# Altium schematic sheet VINREG.SchDoc
size B; SheetNumber: 1; SheetTotal: 4
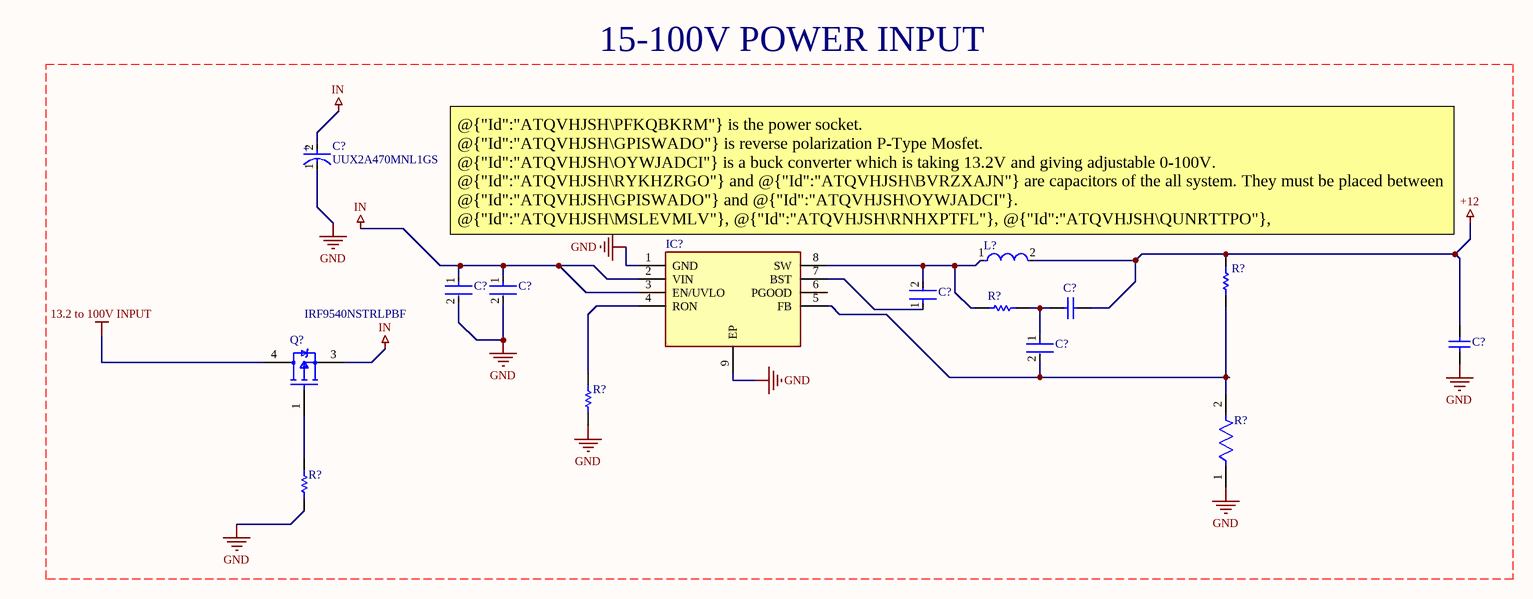
[diagram p0: VINREG.SchDoc]

## Parts
(Parts that share a designator on the sheet are numbered #1, #2 ... from top to bottom, then left to right.)
C?#1  UUX2A470MNL1GS  [FP-UUX2A470MNL1GS-MFG]
C?#2  C3216X7S2A225K160AB  [FP-C3216-160-0_2-IPC_B]  (value not drawn)
C?#3  C3216X7S2A225K160AB  [FP-C3216-160-0_2-IPC_B]  (value not drawn)
C?#4  CAP 3.3nF 16V 0805(2012)  [CAPC0805(2012)145_M]  (value not drawn)
C?#5  C1206C222J5GACTU  [FP-C1206C-EB-MFG]  (value not drawn)
C?#6  C0603C560J5GACTU  [FP-C0603C-CF-MFG]  (value not drawn)
C?#7  C3216JB1E476M160AC  [CAPC3216X180X20LL20]  (value not drawn)
IC?  LM5013DDAR  [SOIC127P600X170-9N]  (value not drawn)
L?  SRR1210-680M  [FP-SRR1210-MFG]  (value not drawn)
Q?  IRF9540NSTRLPBF  [FP-PG-TO263-3-MFG]
R?#1  RG3216P-4533-B-T1  [RESC3216X50X50ML20T20]  (value not drawn)
R?#2  RG3216P-4533-B-T1  [RESC3216X50X50ML20T20]  (value not drawn)
R?#3  RC1206FR-07100KL  [RESC3116X65X40ML10T20]  (value not drawn)
R?#4  ERJ-3EKF1001V  [RESC1608X55X30LL15T15]  (value not drawn)
R?#5  CRCW120649K9FKEB  [FP-CRCW1206-e3-IPC_A]  (value not drawn)

## Nets
13.2 to 100V INPUT: Q?.4(DRAIN)
+12: C?#4.2 C?#7.2 L?.2 R?#2.2
GND: C?#1.1(C) C?#2.2 C?#3.2 C?#7.1 IC?.1(GND) IC?.9(EP) R?#3.1 R?#4.2 R?#5.1
IN: C?#1.2(A) C?#2.1 C?#3.1 IC?.2(VIN) IC?.3(EN/UVLO) Q?.3(SOURCE)
NetC?#4_1: C?#4.1 C?#6.1 R?#1.2
NetC?#5_1: C?#5.1 IC?.7(BST)
NetC?#5_2: C?#5.2 IC?.8(SW) L?.1 R?#1.1
NetC?#6_2: C?#6.2 IC?.5(FB) R?#2.1 R?#5.2
NetIC?_4: IC?.4(RON) R?#3.2
NetQ?_1: Q?.1(GATE) R?#4.1

Not connected (* = marked no-connect by the designer): IC? 6(PGOOD)

## Notes on the sheet
- 15-100V POWER INPUT
- @{"Id":"ATQVHJSH\PFKQBKRM"} is the power socket.
  @{"Id":"ATQVHJSH\GPISWADO"} is reverse polarization P-Type Mosfet.
  @{"Id":"ATQVHJSH\OYWJADCI"} is a buck converter which is taking 13.2V and giving adjustable 0-100V.
  @{"Id":"ATQVHJSH\RYKHZRGO"} and @{"Id":"ATQVHJSH\BVRZXAJN"} are capacitors of the all system. They must be placed between @{"Id":"ATQVHJSH\GPISWADO"} and @{"Id":"ATQVHJSH\OYWJADCI"}.
  @{"Id":"ATQVHJSH\MSLEVMLV"}, @{"Id":"ATQVHJSH\RNHXPTFL"}, @{"Id":"ATQVHJSH\QUNRTTPO"}, @{"Id":"ATQVHJSH\KSHCZMBN"}, @{"Id":"ATQVHJSH\RLKRERCY"}, @{"Id":"ATQVHJSH\IDNKIHTU"}, @{"Id":"ATQVHJSH\TUJFBHMY"}, @{"Id":"ATQVHJSH\PBCWLAUT"}, @{"Id":"ATQVHJSH\HJDGVZZY"}, @{"Id":"ATQVHJSH\PMRRMCJY"} components must be placed near to @{"Id":"ATQVHJSH\OYWJADCI"} because of the heating loss and switching loss.
- (in symbol CMP-2000-07372-2) +

## Library data of the parts
C?#1 = CMP-2000-07372-2: CAP ALUM 47UF 20% 100V SMD; Life (Hours): 2000Hour; Ripple Current (AC): 230mA; Dissipation Factor: 0.08%; Leakage Current: 141uA; Lead Diameter: 1.1mm; Diameter: 10mm; Termination: SMD/SMT; Voltage: 100V; Tolerance: 20%; Voltage Rating: 100V; Packaging: Tape and Reel; Height - Seated (Max): 0.394inch; Case/Package: Radial; Features: General Purpose; Lead Pitch: 4.5mm; Height: 10mm; Min Operating Temperature: -55°C; REACH SVHC: No SVHC; Radiation Hardening: No; Length: 10mm; RoHS Compliant: Yes; Construction: Cylindrical; Capacitance: 47uF; Package Quantity: 500; Voltage Rating (DC): 100V; Ripple Current: 230mA; Series: UX; Max Operating Temperature: 105°C; Mount: Surface Mount
C?#2 C?#3 = CMP-08246-004303-1: Multilayer Ceramic Capacitors 2.2uF ±10% 100V X7S SMD 1206; Min Operating Temperature: -55°C; Tolerance: 10%; Number of Pins: 2; Case Code (Metric): 3216; REACH SVHC: No SVHC; Package Quantity: 1; Capacitance: 2.2uF; Lead Free: Lead Free; Termination: SMD/SMT; Voltage Rating (DC): 100V; Voltage Rating: 100V; Case Code (Imperial): 1206; Dielectric: X7S; Height: 1.6mm; Packaging: Tape and Reel; Weight: 0.000571oz; Radiation Hardening: No; Mount: Surface Mount; Width: 0.063inch; Length: 3.2mm; Case/Package: 1206; Depth: 1.6mm; RoHS Compliant: Yes; Max Operating Temperature: 125°C; Series: C; Voltage: 100V; Resistor Type: Ceramic; Thickness: 0.071inch; Construction: Flat
C?#4 = CMP-1036-03402-1: CAP 3.3nF 16V ±10% 0805 (2012 Metric) Thickness 1.45mm SMD; Case-EIA: 0805; Case-Metric: 2012; Tolerance: Â±10%; Max Thickness: 1.45 mm; Rated Voltage: 16 V; Value: 3.3nF; Technology: SMT
C?#5 = CMP-03020-016793-1: CAP CER 2200PF 50V 5% NP0 1206; Manufacturer: KEMET; Tolerance: 0.05; Value: 2,200 pF; Temperature Characteristic: C0G; Temperature Coefficient: 15%; Automotive Grade: Grade 0; Material: Ceramic; Digikey Description: CAP CER 2200PF 50V 5% NP0 1206; Device Class L3: Ceramic Capacitors; Temperature: -55°C to +150°C; Octopart: https://octopart.com/c1206c222j5gactu-kemet-8089805; Temperature Range Low: -55°C; Device Class L1: Passive Components; Manufacturer Part Number: C1206C222J5GACTU; Automotive: Yes; Package: C1206C-EB; Ipc Land Pattern Name: CAPC320160X78; Voltage Rating: 50 V; Mouser Description: 1206 2.2nF Ceramic Multilayer Capacitor; 50VDC; 125degC; C0G Dielec; +/-5% SMD; Lead Free: Yes; ComponentLink2Description: Datasheet; Device Class L2: Capacitors; Capacitance: 2,200 pF; RoHS: TRUE; Category: Cap; Temperature Range High: +150°C; ComponentLink2URL: https://content.kemet.com/datasheets/KEM_C1007_X8R_ULTRA_150C_SMD.pdf; Height: 0.88mm
C?#6 = CMP-1035-01122-3: CAP CER 56PF 50V C0G/NP0 0603; Manufacturer: KEMET; Temperature Coefficient: 30ppm/°C; Temperature Characteristic: C0G; Material: Ceramic; Tolerance: 0.05; Automotive Grade: Grade 1; Automotive: Yes; Lead Free: Yes; Voltage Rating: 50 V; Package: C0603C-CF; Device Class L1: Passive Components; Octopart: https://octopart.com/c0603c560j5gactu-kemet-107933; Temperature Range High: +125°C; RoHS: TRUE; Device Class L2: Capacitors; Capacitance: 56 pF; Device Class L3: Ceramic Capacitors; Digikey Description: CAP CER 56PF 50V C0G/NP0 0603; Temperature: -55°C to +125°C; Category: Cap; Manufacturer Part Number: C0603C560J5GACTU; Value: 56 pF; ComponentLink2Description: Datasheet; ComponentLink2URL: https://api.kemet.com/component-edge/download/datasheet/C0603C100J5GACAUTO.pdf; Height: 0.87mm; Mouser Description: Cap Ceramic 56pF 50V C0G 5% SMD 0603 125°C Paper T/R; Temperature Range Low: -55°C
C?#7 = CMP-2000-07441-1: Chip Capacitor, 47 uF, +/- 20%, 25 V, -25 to 85 degC, 1206 (3216 Metric), RoHS, Tape and Reel; Manufacturer: TDK; Mounting Technology: SurfaceMount; Package Reference: 1206; Datasheet Version: 07/2017; Package URL: https://product.tdk.com/info/en/documents/chara_sheet/C3216X7R1V106K160AC.pdf; Package Description: 2-Pin Surface Mount Device, Body 3.2 x 1.6 mm; Datasheet URL: https://product.tdk.com/info/en/catalog/datasheets/mlcc_commercial_general_en.pdf; Manufacturer URL: http://www.tdk.com/
IC? = LM5013DDAR: Integrated Circuit; Manufacturer_Name: Texas Instruments; Datasheet Link: https://www.ti.com/lit/ds/symlink/lm5013.pdf; Height: 1.7mm; Manufacturer_Part_Number: LM5013DDAR; Mouser Part Number: 595-LM5013DDAR; Mouser Price/Stock: https://www.mouser.co.uk/ProductDetail/Texas-Instruments/LM5013DDAR?qs=T%252BzbugeAwjiWkH6WZkskpg%3D%3D; Arrow Part Number: LM5013DDAR; Arrow Price/Stock: https://www.arrow.com/en/products/lm5013ddar/texas-instruments?region=nac
L? = CMP-07248-000002-1: FIXED IND 68UH 3A 102 MOHM SMD; Manufacturer: Bourns; Shielding: true; Q Factor: 12; Series Resistance: 102mΩ; Saturation Current: 2.7A; Tolerance: 20%; Core Material: Ferrite; Self Resonant Frequency: 3.8MHz; Test Frequency: 2.52MHz; ComponentLink2Description: Datasheet; Inductance: 68uH; Rms Current: 3A; Device Class L3: Fixed Inductors; Lead Free: Yes; Composition: Wirewound; Value: 68uH; Temperature: -40°C to +125°C; Automotive: No; RoHS: TRUE; Category: Ind; Device Class L2: Inductors; Height: 10mm; Temperature Range Low: -40°C; Package: SRR1210; Device Class L1: Passive Components; Temperature Range High: +125°C; Mouser Description: Fixed Inductors 68uH 20% SMD 1210; ComponentLink2URL: https://www.bourns.com/docs/Product-Datasheets/SRR1210.pdf; Digikey Description: FIXED IND 68UH 3A 102 MOHM SMD; Octopart: https://octopart.com/srr1210-680m-bourns-10487145; Manufacturer Part Number: SRR1210-680M
Q? = CMP-32901-000164-1: MOSFET P-CH 100V 23A D2PAK; Manufacturer: Infineon; Drain To Source Resistance: 117mΩ; Depletion Mode: False; Max Junction Temp: +150°C; Drain To Source Breakdown Voltage: -100V; Reverse Recovery Charge: 890nC; Pulse Drain Current: -92A; Standoff Height: 0mm; Power Dissipation: 110W; Max Forward Diode Voltage: -1.6V; Reverse Recovery Time: 140ns; Turn Off Delay Time: 40ns; Number Of Channels: 1; Continuous Drain Current: -23A; Rthja Max: 40°C/W; Gate Charge At Vgs: 73nC @ -10V; Turn On Delay Time: 13ns; Gate To Source Voltage: 20V; Input Capacitace At Vds: 1450pF @ -25V; Threshold Vgs Max: -4V; Threshold Vgs Min: -2V; Footprint Url: https://www.infineon.com/cms/en/product/packages/PG-TO263/PG-TO263-3-901/#!packing; Category: Trans; Device Class L2: Transistors; Digikey Description: MOSFET P-CH 100V 23A D2PAK; Package: PG-TO263-3; Drain To Source Voltage: -100V; ComponentLink2Description: Datasheet; Number Of P Channels: 1; RoHS: TRUE; Temperature: -55°C to +150°C; Temperature Range Low: -55°C; ComponentLink2URL: https://www.infineon.com/dgdl/irf9540nspbf.pdf?fileId=5546d462533600a401535611d92a1dca; Temperature Range High: +150°C; Manufacturer Part Number: IRF9540NSTRLPBF; Automotive: No; Device Class L1: Discrete Semiconductors; Octopart: https://octopart.com/irf9540nstrlpbf-infineon-65873776; Height: 5.084mm; Lead Free: Yes; Device Class L3: MOSFETs
R?#1 R?#2 = CMP-2003-02644-1: Manufacturer: Susumu; Part Number: RG3216P-4533-B-T1
R?#3 = CMP-2100-03674-1: Chip Resistor, 100 KOhm, +/- 1%, 0.25 W, -55 to 155 degC, 1206 (3216 Metric), RoHS, Tape and Reel; Manufacturer: Yageo; Voltage Rating: 200V; Temperature Coefficient: 100ppm/degreesC; Power Rating: 250mW; Case Code (Metric): 3216; Composition: ThickFilm; Lead Free: LeadFree; Max Operating Temperature: 155degC; Case/Package: 1206; Min Operating Temperature: -55degC; Depth: 1.6mm; RoHSCompliant: true; Datasheet URL: http://www.yageo.com/NewPortal/yageodocoutput?fileName=/pdf/R-Chip/PYu-RC_Group_51_RoHS_L_5.pdf; Datasheet Version: Rev. 5, 10/2016; Package Reference: 1206.0; Packaging: TapeandReel; Resistance: 100KOhm; Manufacturer URL: http://www.yageo.com/; Tolerance: 1%; Height: 0.55mm; REACH SVHC: NoSVHC; Case Code (Imperial): 1206; Length: 3.1mm; Package Description: 2-Pin Surface Mount Device, Body 3.1 x 1.6 mm; Termination: SMD/SMT
R?#4 = CMP-2000-00180-1: Manufacturer: Panasonic; Part Number: ERJ-3EKF1001V
R?#5 = CMP-02407-006044-1: RES Thick Film, 49.9kΩ, 1%, 0.25W, 100ppm/°C, 1206; Power Rating: 250mW; Voltage Rating: 200V; Resistance: 49.9kR; Case Code (Imperial): 1206; Features: Automotive AEC-Q200; Number of Terminations: 2; Case/Package: 1206; Weight: 0.000353oz; Military Standard: Not; Width: 1.6mm; Lead Free: Lead Free; Min Operating Temperature: -55°C; Tolerance: 1%; Packaging: Tape and Reel; Max Operating Temperature: 155°C; Temperature Coefficient: 100ppm/°C; Length: 3.2mm; Package Quantity: 10000; Case Code (Metric): 3216; Contact Plating: Tin; Termination: SMD/SMT; Radiation Hardening: No; Height: 0.024inch; Depth: 1.6mm; Composition: Thick Film; Max Power Dissipation: 250mW